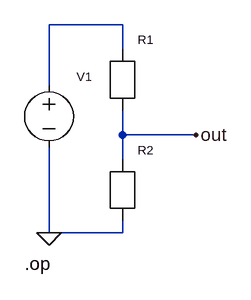
[diagram p0: schematic divider.asc]
divider.asc, the LTspice schematic file:
Version 4
SHEET 1 880 680
WIRE 128 64 32 64
WIRE 128 96 128 64
WIRE 128 208 128 176
WIRE 128 240 128 208
WIRE 224 208 128 208
WIRE 32 144 32 64
WIRE 32 336 32 224
WIRE 128 336 128 320
WIRE 128 336 32 336
FLAG 32 336 0
FLAG 224 208 out
SYMBOL voltage 32 128 R0
SYMATTR InstName V1
SYMATTR Value 5
SYMBOL res 112 80 R0
SYMATTR InstName R1
SYMATTR Value 10k
SYMBOL res 112 224 R0
SYMATTR InstName R2
SYMATTR Value 10k
TEXT 0 376 Left 2 !.op

The netlist it stands for:
* divider.asc
V1 N001 0 5
R1 N001 out 10k
R2 out 0 10k
.op
.backanno
.end